# Altium project IBSP3030ADJMS10R00.PrjPcb
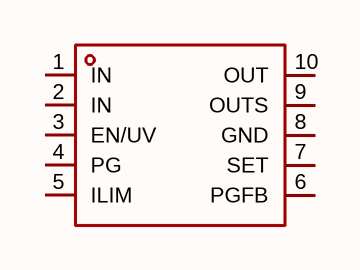
[diagram p0: IBSP3030ADJMS10R00.schdoc]
1 sheet, 1 parts. Net scope: global (net labels, ports and power ports of the same name join across sheets).

## Sheet IBSP3030ADJMS10R00.schdoc
size 127 x 101 mm

### Parts
U?  ibsp3030adjms10r00  [MSOP-10_L3.0-W3.0-P0.50-LS5.0-BL]  (value not drawn)

### Nets

Not connected (* = marked no-connect by the designer): U? 1(IN) 2(IN) 3(EN/UV) 4(PG) 5(ILIM) 6(PGFB) 7(SET) 8(GND) 9(OUTS) 10(OUT)

### Library data of the parts
U? = ibsp3030adjms10r00: 输出极性:正极;工作电压:20V;输出电压:500mV~16V;输出电流:200mA;电源纹波抑制比(PSRR):120dB@(100Hz);输出类型:可调;; Manufacturer: Inbisen(英彼森半导体); AddInBom: yes; ModelId: b42a31f9e1fa4643bc7ea573b9bba7ed; ModelName: MSOP-10_L3.0-W3.0-H1.1-LS5.0-P0.50; ModelTransform: 118.11,196.85,0,0,0,0,0,0,0; Output Configuration: 正极; Voltage - Supply: 20V; Output Current: 200mA; Voltage Dropout: 350mV@(200mA); standby current: 3.2mA; Noise: 1.6uVrms; Output Type: 可调; Number of Outputs: 1; Symbol: IBSP3030ADJMS10R00; LCSC Part Name: 500mV~16V 200mA 20V; SupplierPart: C42389820; ManufacturerPart: IBSP3030ADJMS10R00; Supplier Footprint: MSOP-10; JLCPCB Part Class: Extended Part; Datasheet: https://item.szlcsc.com/datasheet/IBSP3030ADJMS10R00/44322977.html; Supplier: LCSC; ConvertToPcb: yes; FootprintName: MSOP-10_L3.0-W3.0-P0.50-LS5.0-BL; Output Voltage: 500mV~16V; Power Supply Rejection Ratio (PSRR): 120dB@(100Hz); Features: 可调限流；使能控制；工作状态指示；短路保护；过流保护；反极性电流保护；热关断；输入欠压保护; Operating Temperature: -40℃~+125℃@(Ta)